# EAGLE schematic 1794743576046_Budík-Venkovni teplota (EAGLE 9.6.2)
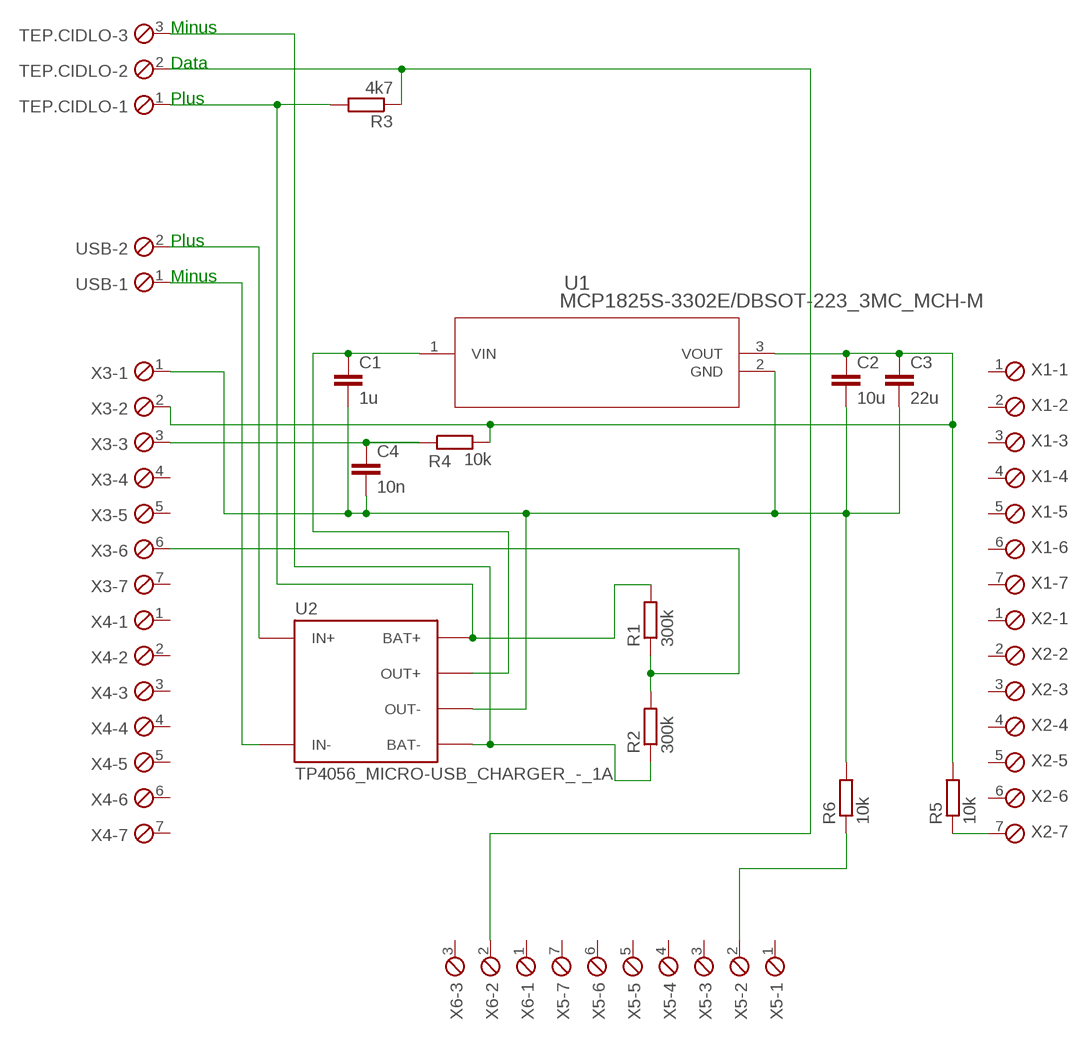
[diagram p0: schematic, sheet 1]

## Parts
C1  1u  C-EUC0805  [C0805]
C2  10u  C-EUC0805  [C0805]
C3  22u  C-EUC0805  [C0805]
C4  10n  C-EUC0805  [C0805]
R1  300k  R-EU_0204/7  [0204/7]
R2  300k  R-EU_0204/7  [0204/7]
R3  4k7  R-EU_0204/7  [0204/7]
R4  10k  R-EU_0204/7  [0204/7]
R5  10k  R-EU_0204/7  [0204/7]
R6  10k  R-EU_0204/7  [0204/7]
TEP.CIDLO  MPT3  [3POL254]
U1  MCP1825S-3302E/DBSOT-223_3MC_MCH-M  [SOT-223_3MC_MCH-M]
U2  TP4056_MICRO-USB_CHARGER_-_1A  [MODULE_TP4056_MICRO-USB_CHARGER_-_1A]
USB  MPT2  [2POL254]
X1  MPT7  [7POL254]
X2  MPT7  [7POL254]
X3  MPT7  [7POL254]
X4  MPT7  [7POL254]
X5  MPT7  [7POL254]
X6  MPT3  [3POL254]

## Nets
N$1: U2.IN_N(IN-) USB.1
N$2: U2.IN_P(IN+) USB.2
N$3: R1.2 R3.2 TEP.CIDLO.1 U2.BAT_P(BAT+)
N$4: R2.1 TEP.CIDLO.3 U2.BAT_N(BAT-)
N$5: C1.1 U1.1(VIN) U2.OUT_P(OUT+)
N$6: C1.2 C2.2 C3.2 C4.2 R6.2 U1.2(GND) U2.OUT_N(OUT-) X3.1
N$7: C2.1 C3.1 R4.2 R5.2 U1.3(VOUT) X3.2
N$8: R1.1 R2.2 X3.6
N$9: R3.1 TEP.CIDLO.2 X6.2
N$14: C4.1 R4.1 X3.3
N$15: R5.1 X2.7
N$16: R6.1 X5.2
Unconnected: X1.1 X1.2 X1.3 X1.4 X1.5 X1.6 X1.7 X2.1 X2.2 X2.3 X2.4 X2.5 X2.6 X3.4 X3.5 X3.7 X4.1 X4.2 X4.3 X4.4 X4.5 X4.6 X4.7 X5.1 X5.3 X5.4 X5.5 X5.6 X5.7 X6.1 X6.3

## Notes on the sheet
- Minus
- Data
- Plus
- Plus
- Minus

## Library data of the parts
C1-C4 = rcl:C-EU: CAPACITOR, European symbol; SPICEPREFIX: C
R1-R6 = rcl-vetši pad:R-EU_: RESISTOR, European symbol; SPICEPREFIX: R
TEP.CIDLO X6 = con-phoenix-254:MPT3: PHOENIX CONNECTOR; OC_FARNELL: unknown; OC_NEWARK: unknown
U1 = Stabilizator-MCP1825S:MCP1825S-3302E/DB; COPYRIGHT: Copyright (C) 2026 Ultra Librarian. All rights reserved.; MANUFACTURER_NAME: Microchip; MANUFACTURER_PART_NUMBER: MCP1825S-3302E/DB
U2 = TP4056_MICRO-USB_CHARGER_-_1A:TP4056_MICRO-USB_CHARGER_-_1A: Check availability <https://pricing.snapeda.com/parts/TP4056%20Micro-USB%20Charger%20-%201A/Generic/view-part?ref=eda>; AVAILABILITY: Not in stock; CHECK_PRICES: https://www.snapeda.com/parts/TP4056%20Micro-USB%20Charger%20-%201A/Generic/view-part/?ref=eda; DESCRIPTION: The TP4056ES Li-Ion micro USB charger is an improved version of the TP4056, ideal for 18650 batteries, with a micro USB connection for direct PC charging.; MF: Generic; MP: TP4056 Micro-USB Charger - 1A; PACKAGE: Package; PRICE: None; SNAPEDA_LINK: https://www.snapeda.com/parts/TP4056%20Micro-USB%20Charger%20-%201A/Generic/view-part/?ref=snap
USB = con-phoenix-254:MPT2: PHOENIX CONNECTOR; OC_FARNELL: unknown; OC_NEWARK: unknown
X1-X5 = con-phoenix-254:MPT7: PHOENIX CONNECTOR; OC_FARNELL: unknown; OC_NEWARK: unknown

## Net classes
0 default: width 0.5 mm, drill 0.3 mm, clearance 0.3 mm